# Altium schematic sheet [04] - MECHANICAL.SchDoc
size A4; DocumentNumber: 4; SheetNumber: 4; SheetTotal: 6
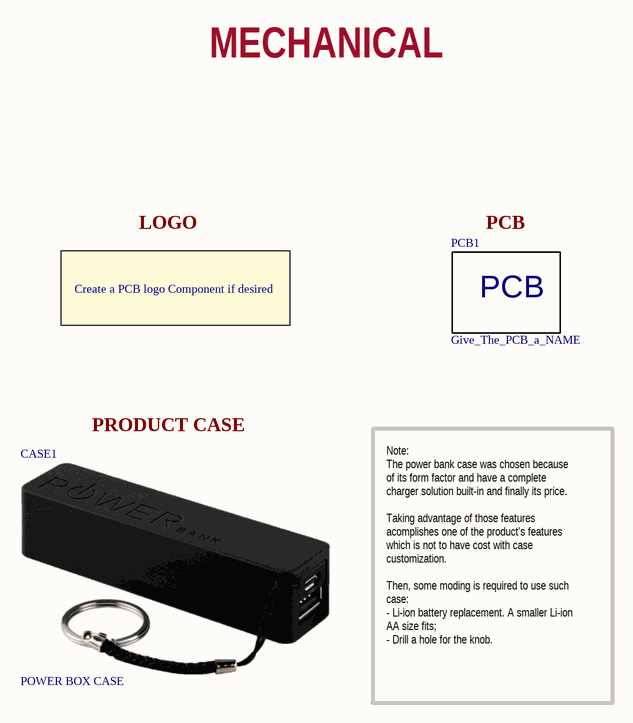
[diagram p0: [04] - MECHANICAL.SchDoc]

## Parts
CASE1  POWER BOX CASE
PCB1  Give_The_PCB_a_NAME

## Notes on the sheet
- MECHANICAL
- LOGO
- PCB
- Create a PCB logo Component if desired
- PRODUCT CASE
- Note:
  The power bank case was chosen because of its form factor and have a complete charger solution built-in and finally its price.
  Taking advantage of those features acomplishes one of the product's features which is not to have cost with case customization.
  Then, some moding is required to use such case:
  - Li-ion battery replacement. A smaller Li-ion AA size fits;
  - Drill a hole for the knob.
- Project:
- Revision:
- Engineer:
- Title:
- Page
- of
- Embedded Things
- Date:
- Hour:
- Variant:

## Library data of the parts
PCB1 = PCB: Printed Circuit Board; Category: Printed Circuit Board